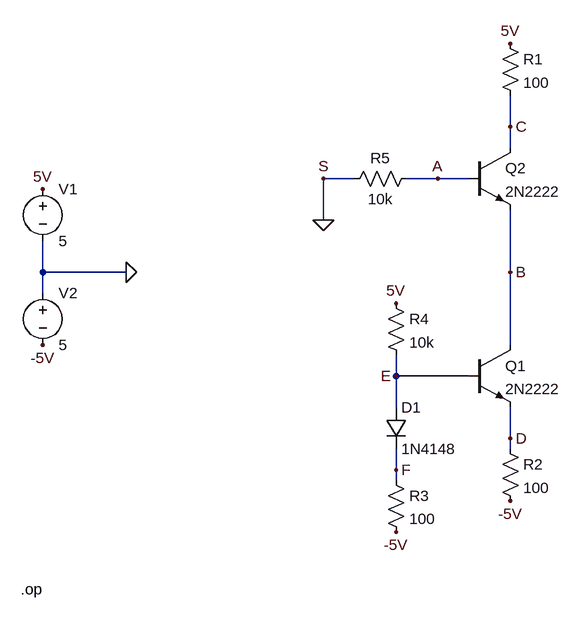
[diagram p0: schematic problem1dc.asc]
problem1dc.asc, the LTspice schematic file:
Version 4
SHEET 1 880 680
WIRE 272 -176 272 -224
WIRE 272 -144 272 -176
WIRE 32 -96 -16 -96
WIRE 160 -96 112 -96
WIRE 208 -96 160 -96
WIRE -16 -32 -16 -96
WIRE -448 48 -448 0
WIRE -320 48 -448 48
WIRE 272 48 272 -48
WIRE -448 80 -448 48
WIRE 272 160 272 48
WIRE 96 208 96 176
WIRE 208 208 96 208
WIRE 96 256 96 208
WIRE 272 304 272 256
WIRE 272 320 272 304
WIRE 96 352 96 320
WIRE 96 368 96 352
FLAG -16 -32 0
FLAG -320 48 0
FLAG -448 -80 5V
FLAG 272 -304 5V
FLAG -448 160 -5V
FLAG 272 400 -5V
FLAG 96 448 -5V
FLAG 96 96 5V
FLAG 272 -176 C
FLAG 160 -96 A
FLAG 272 48 B
FLAG 96 208 E
FLAG 272 304 D
FLAG 96 352 F
FLAG -16 -96 S
SYMBOL diode 80 256 R0
SYMATTR InstName D1
SYMATTR Value 1N4148
SYMBOL npn 208 160 R0
SYMATTR InstName Q1
SYMATTR Value 2N2222
SYMBOL npn 208 -144 R0
SYMATTR InstName Q2
SYMATTR Value 2N2222
SYMBOL res 256 -320 R0
SYMATTR InstName R1
SYMATTR Value 100
SYMBOL res 256 304 R0
SYMATTR InstName R2
SYMATTR Value 100
SYMBOL res 80 352 R0
SYMATTR InstName R3
SYMATTR Value 100
SYMBOL res 128 -112 R90
WINDOW 0 0 56 VBottom 2
WINDOW 3 32 56 VTop 2
SYMATTR InstName R5
SYMATTR Value 10k
SYMBOL res 80 80 R0
SYMATTR InstName R4
SYMATTR Value 10k
SYMBOL voltage -448 -96 R0
WINDOW 123 0 0 Left 0
WINDOW 39 0 0 Left 0
SYMATTR InstName V1
SYMATTR Value 5
SYMBOL voltage -448 64 R0
WINDOW 123 0 0 Left 0
WINDOW 39 0 0 Left 0
SYMATTR InstName V2
SYMATTR Value 5
TEXT -482 536 Left 2 !.op

The netlist it stands for:
* problem1dc.asc
D1 E F 1N4148
Q1 B E D 0 2N2222
Q2 C A B 0 2N2222
R1 5V C 100
R2 D -5V 100
R3 F -5V 100
R5 A 0 10k
R4 5V E 10k
V1 5V 0 5
V2 0 -5V 5
.model D D
.lib standard.dio
.model NPN NPN
.model PNP PNP
.lib standard.bjt
.op
.backanno
.end